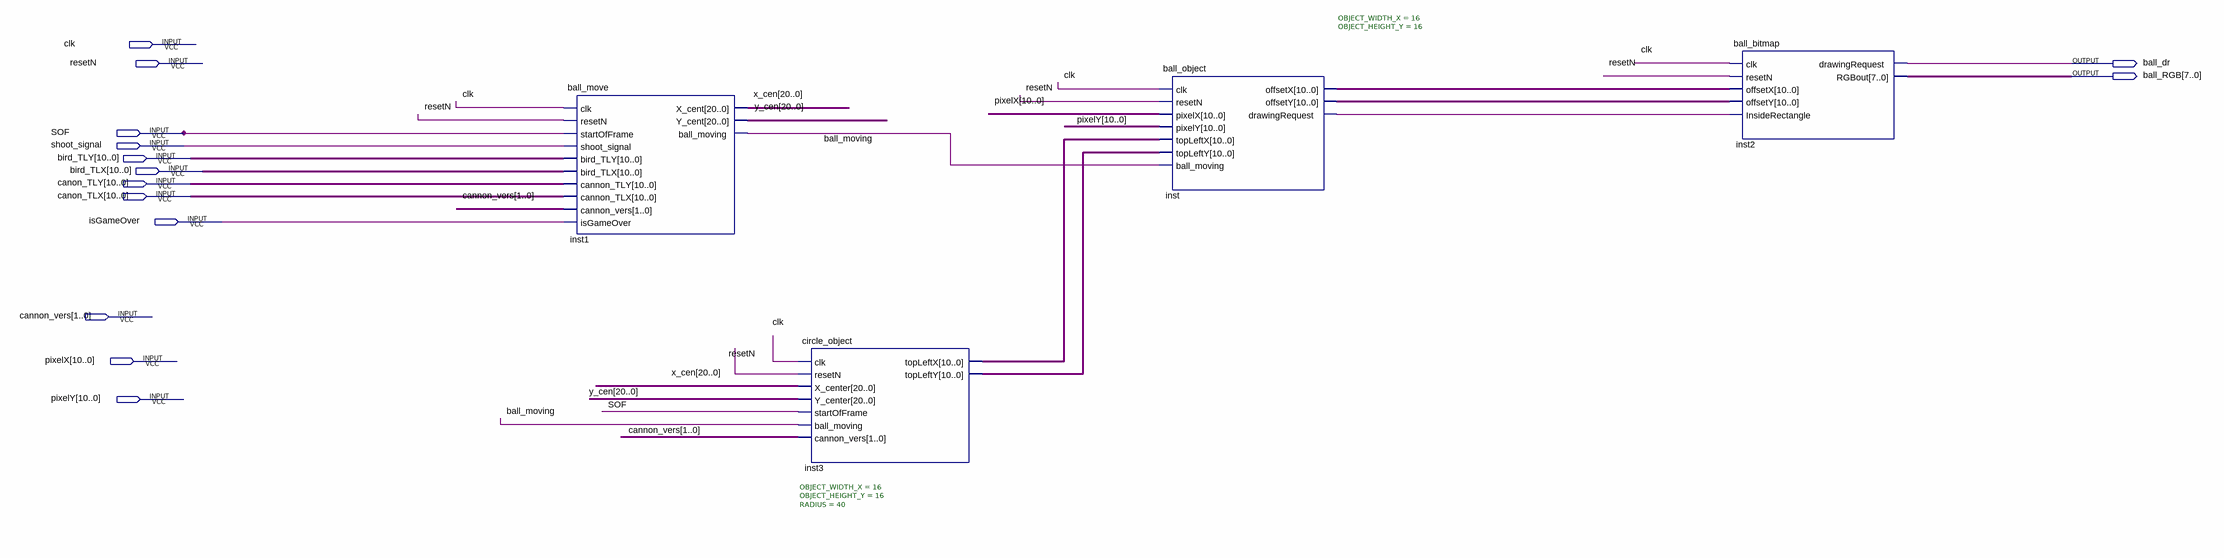
[diagram p0: schematic sheet]
// Quartus schematic cannon_ball_block.bdf as structural Verilog: 4 symbols, 14 pins
module cannon_ball_block (
  input  clk,
  input  resetN,
  input  SOF,
  input  shoot_signal,
  input  [10:0] bird_TLY,
  input  [10:0] bird_TLX,
  input  [10:0] canon_TLY,
  input  [10:0] canon_TLX,
  input  isGameOver,
  input  [1:0] cannon_vers,
  input  [10:0] pixelX,
  input  [10:0] pixelY,
  output ball_dr,
  output [7:0] ball_RGB
);

  wire ball_moving, inst_drawingrequest;
  wire [10:0] inst3_topleftx, inst3_toplefty, inst_offsetx, inst_offsety;
  wire [20:0] x_cen, y_cen;

  ball_move inst1 (
    .clk(clk), .resetN(resetN), .startOfFrame(SOF), .shoot_signal(shoot_signal), .bird_TLY(bird_TLY),
    .bird_TLX(bird_TLX), .cannon_TLY(canon_TLY), .cannon_TLX(canon_TLX), .cannon_vers(cannon_vers),
    .isGameOver(isGameOver), .X_cent(x_cen), .Y_cent(y_cen), .ball_moving(ball_moving));
  circle_object #(.OBJECT_WIDTH_X(16), .OBJECT_HEIGHT_Y(16), .RADIUS(40)) inst3 (
    .clk(clk), .resetN(resetN), .X_center(x_cen), .Y_center(y_cen), .startOfFrame(SOF),
    .ball_moving(ball_moving), .cannon_vers(cannon_vers), .topLeftX(inst3_topleftx), .topLeftY(inst3_toplefty));
  ball_object #(.OBJECT_WIDTH_X(16), .OBJECT_HEIGHT_Y(16)) inst (
    .clk(clk), .resetN(resetN), .pixelX(pixelX), .pixelY(pixelY), .topLeftX(inst3_topleftx),
    .topLeftY(inst3_toplefty), .ball_moving(ball_moving), .offsetX(inst_offsetx), .offsetY(inst_offsety),
    .drawingRequest(inst_drawingrequest));
  ball_bitmap inst2 (
    .clk(clk), .resetN(resetN), .offsetX(inst_offsetx), .offsetY(inst_offsety),
    .InsideRectangle(inst_drawingrequest), .drawingRequest(ball_dr), .RGBout(ball_RGB));
endmodule
